# Altium schematic sheet Extension Connector.SchDoc
size 406 x 304 mm; SheetNumber: 9; SheetTotal: 9
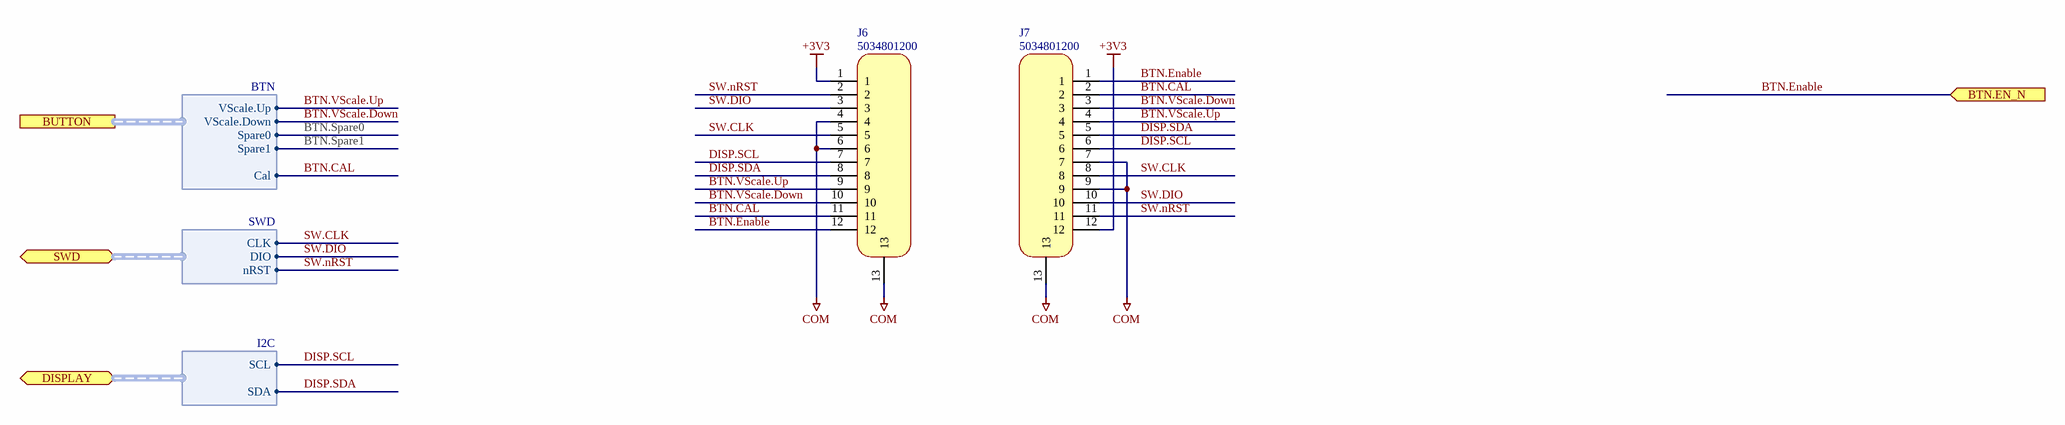
[diagram p0: Extension Connector.SchDoc]

## Parts
J6  5034801200  [MOLEX_5034801200]
J7  5034801200  [MOLEX_5034801200]

## Ports
BTN.EN_N (in), BUTTON (harness BTN), DISPLAY (bidir, harness I2C), SWD (bidir, harness SWD)

## Harnesses
BTN: VScale.Up, VScale.Down, Spare1, Cal, Spare0
SWD: CLK, DIO, nRST
I2C: SCL, SDA

## Nets
+3V3: J6.1 J7.12
COM: J6.4 J6.6 J6.13 J7.7 J7.9 J7.13
BTN.CAL: J6.11 J7.2 ; port BUTTON.Cal
BTN.Enable: J6.12 J7.1 ; port BTN.EN_N
BTN.Spare0: port BUTTON.Spare0
BTN.Spare1: port BUTTON.Spare1
BTN.VScale.Down: J6.10 J7.3 ; port BUTTON.VScale.Down
BTN.VScale.Up: J6.9 J7.4 ; port BUTTON.VScale.Up
DISP.SCL: J6.7 J7.6 ; port DISPLAY.SCL
DISP.SDA: J6.8 J7.5 ; port DISPLAY.SDA
SW.CLK: J6.5 J7.8 ; port SWD.CLK
SW.DIO: J6.3 J7.10 ; port SWD.DIO
SW.nRST: J6.2 J7.11 ; port SWD.nRST

## Notes on the sheet
- Sheet Name:
- Date:
- Sheet
- Designer:
- of

## Library data of the parts
J6 J7 = Conn,FPC,12pin,RA,0.5mm,5034801200: CONN FFC FPC 12POS 0.5mm TOP AND BOTTOM CNT SMD R/A; Manufacturer 1: Molex; Part Name: Conn,FPC,12pin,RA,0.5mm,5034801200; CreatedBy: Kevin Heyer; HelpURL: https://www.molex.com/content/dam/molex/molex-dot-com/products/automated/en-us/salesdrawingpdf/503/503480/5034801200_sd.pdf?inline\; Manufacturer 1 Part Number: 5034801200